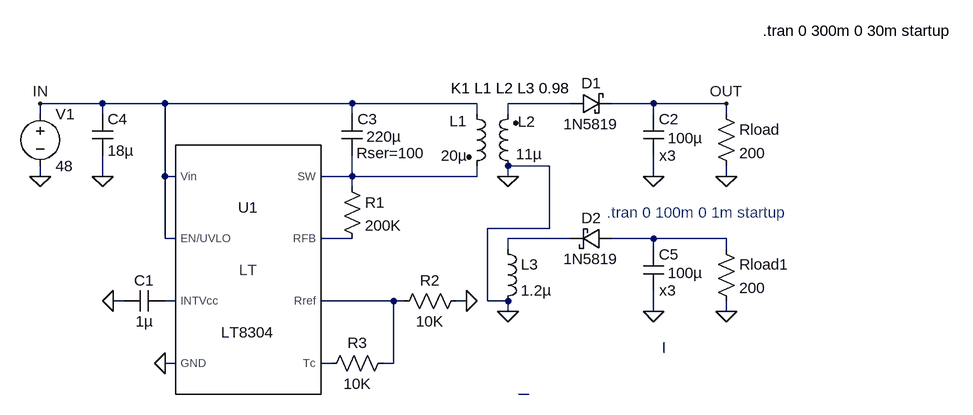
[diagram p0: schematic LT8304_DC2393A - Copy.asc]
LT8304_DC2393A - Copy.asc, the LTspice schematic file:
Version 4.1
SHEET 1 1632 680
WIRE -32 -64 -128 -64
WIRE 64 -64 -32 -64
WIRE 352 -64 64 -64
WIRE 544 -64 352 -64
WIRE 688 -64 592 -64
WIRE 816 -64 752 -64
WIRE 928 -64 816 -64
WIRE -128 -48 -128 -64
WIRE -32 -48 -32 -64
WIRE 352 -48 352 -64
WIRE 544 -48 544 -64
WIRE 592 -48 592 -64
WIRE 816 -48 816 -64
WIRE 928 -48 928 -64
WIRE 656 32 592 32
WIRE -128 48 -128 32
WIRE -32 48 -32 16
WIRE 64 48 64 -64
WIRE 80 48 64 48
WIRE 352 48 352 16
WIRE 352 48 304 48
WIRE 544 48 544 32
WIRE 544 48 352 48
WIRE 592 48 592 32
WIRE 816 48 816 16
WIRE 928 48 928 32
WIRE 352 64 352 48
WIRE 656 128 656 32
WIRE 656 128 560 128
WIRE 64 144 64 48
WIRE 80 144 64 144
WIRE 352 144 304 144
WIRE 688 144 592 144
WIRE 816 144 752 144
WIRE 928 144 816 144
WIRE 592 160 592 144
WIRE 816 160 816 144
WIRE 928 160 928 144
WIRE 0 240 -16 240
WIRE 80 240 64 240
WIRE 416 240 304 240
WIRE 432 240 416 240
WIRE 528 240 512 240
WIRE 560 240 560 128
WIRE 592 240 560 240
WIRE 592 256 592 240
WIRE 816 256 816 224
WIRE 928 256 928 240
WIRE 832 320 832 304
WIRE 80 336 64 336
WIRE 320 336 304 336
WIRE 416 336 416 240
WIRE 416 336 400 336
WIRE 624 384 608 384
FLAG 64 336 0
FLAG -128 48 0
FLAG -16 240 0
FLAG 528 240 0
FLAG 928 48 0
FLAG -128 -64 IN
FLAG 592 48 0
FLAG 816 48 0
FLAG -32 48 0
FLAG 928 -64 OUT
FLAG 928 256 0
FLAG 592 256 0
FLAG 816 256 0
SYMBOL voltage -128 -64 R0
SYMATTR InstName V1
SYMATTR Value 48
SYMBOL cap 64 224 R90
WINDOW 0 0 32 VBottom 2
WINDOW 3 32 32 VTop 2
SYMATTR InstName C1
SYMATTR Value 1µ
SYMBOL ind2 528 -64 R0
WINDOW 0 1 27 Right 2
WINDOW 3 1 80 Right 2
SYMATTR InstName L1
SYMATTR Value 20µ
SYMATTR Type ind
SYMATTR SpiceLine Rser=1m Rpar=100k Cpar=5p
SYMBOL ind2 608 48 R180
WINDOW 0 1 84 Right 2
WINDOW 3 4 34 Right 2
SYMATTR InstName L2
SYMATTR Value 11µ
SYMATTR Type ind
SYMATTR SpiceLine Rser=1m
SYMBOL schottky 688 -48 R270
WINDOW 0 32 32 VTop 2
WINDOW 3 0 32 VBottom 2
SYMATTR InstName D1
SYMATTR Value 1N5819
SYMATTR Description Diode
SYMATTR Type diode
SYMBOL cap 800 -48 R0
WINDOW 3 38 37 Left 2
WINDOW 123 25 64 Left 2
SYMATTR Value 100µ
SYMATTR Value2 x3
SYMATTR InstName C2
SYMATTR SpiceLine Rser=2m
SYMBOL cap 336 -48 R0
WINDOW 39 23 60 Left 2
WINDOW 3 38 35 Left 2
SYMATTR SpiceLine Rser=100
SYMATTR Value 220µ
SYMATTR InstName C3
SYMBOL res 336 48 R0
SYMATTR InstName R1
SYMATTR Value 200K
SYMBOL res 416 256 R270
WINDOW 0 32 56 VTop 2
WINDOW 3 0 56 VBottom 2
SYMATTR InstName R2
SYMATTR Value 10K
SYMBOL res 416 320 R90
WINDOW 0 0 56 VBottom 2
WINDOW 3 32 56 VTop 2
SYMATTR InstName R3
SYMATTR Value 10K
SYMBOL res 912 -64 R0
SYMATTR InstName Rload
SYMATTR Value 200
SYMBOL LT8304 192 192 R0
SYMATTR InstName U1
SYMBOL cap -48 -48 R0
SYMATTR InstName C4
SYMATTR Value 18µ
SYMBOL schottky 752 128 R90
WINDOW 0 0 32 VBottom 2
WINDOW 3 32 32 VTop 2
SYMATTR InstName D2
SYMATTR Value 1N5819
SYMATTR Description Diode
SYMATTR Type diode
SYMBOL cap 800 160 R0
WINDOW 3 38 37 Left 2
WINDOW 123 25 64 Left 2
SYMATTR Value 100µ
SYMATTR Value2 x3
SYMATTR InstName C5
SYMATTR SpiceLine Rser=2m
SYMBOL res 912 144 R0
SYMATTR InstName Rload1
SYMATTR Value 200
SYMBOL ind 576 144 R0
SYMATTR InstName L3
SYMATTR Value 1.2µ
SYMATTR Type ind
SYMATTR SpiceLine Rser=1m
TEXT 504 -88 Left 2 !K1 L1 L2 L3 0.98
TEXT 744 104 Left 2 ;.tran 0 100m 0 1m startup
TEXT 984 -176 Left 2 !.tran 0 300m 0 30m startup

The netlist it stands for:
* LT8304_DC2393A - Copy.asc
V1 IN 0 48
C1 N006 0 1µ
L1 IN N002 20µ Rser=1m Rpar=100k Cpar=5p
L2 0 N001 11µ Rser=1m
D1 N001 OUT 1N5819
C2 OUT 0 100µ x3 Rser=2m
C3 IN N002 220µ Rser=100
R1 N002 N003 200K
R2 N007 0 10K
R3 N007 N009 10K
Rload OUT 0 200
X§U1 IN N006 IN 0 N002 N003 N007 N009 LT8304  ; pins EN/UVLO INTVcc Vin GND SW RFB Rref Tc
C4 IN 0 18µ
D2 N005 N004 1N5819
C5 N005 0 100µ x3 Rser=2m
Rload1 N005 0 200
L3 N004 0 1.2µ Rser=1m
.model D D
.lib standard.dio
K1 L1 L2 L3 0.98
* .tran 0 100m 0 1m startup
.tran 0 300m 0 30m startup
.lib LT8304.sub
.backanno
.end